# EasyEDA Pro project goddamn.epro

# Schematic Schematic1
Board Name: Board1; Create Date: 2025-03-29; Page Name: P1; Project Name: 2025329小车; Schematic Name: Schematic1; Update Date: 2025-03-29; Company: 嘉立创EDA; Page Size: A4; Version: V1.0
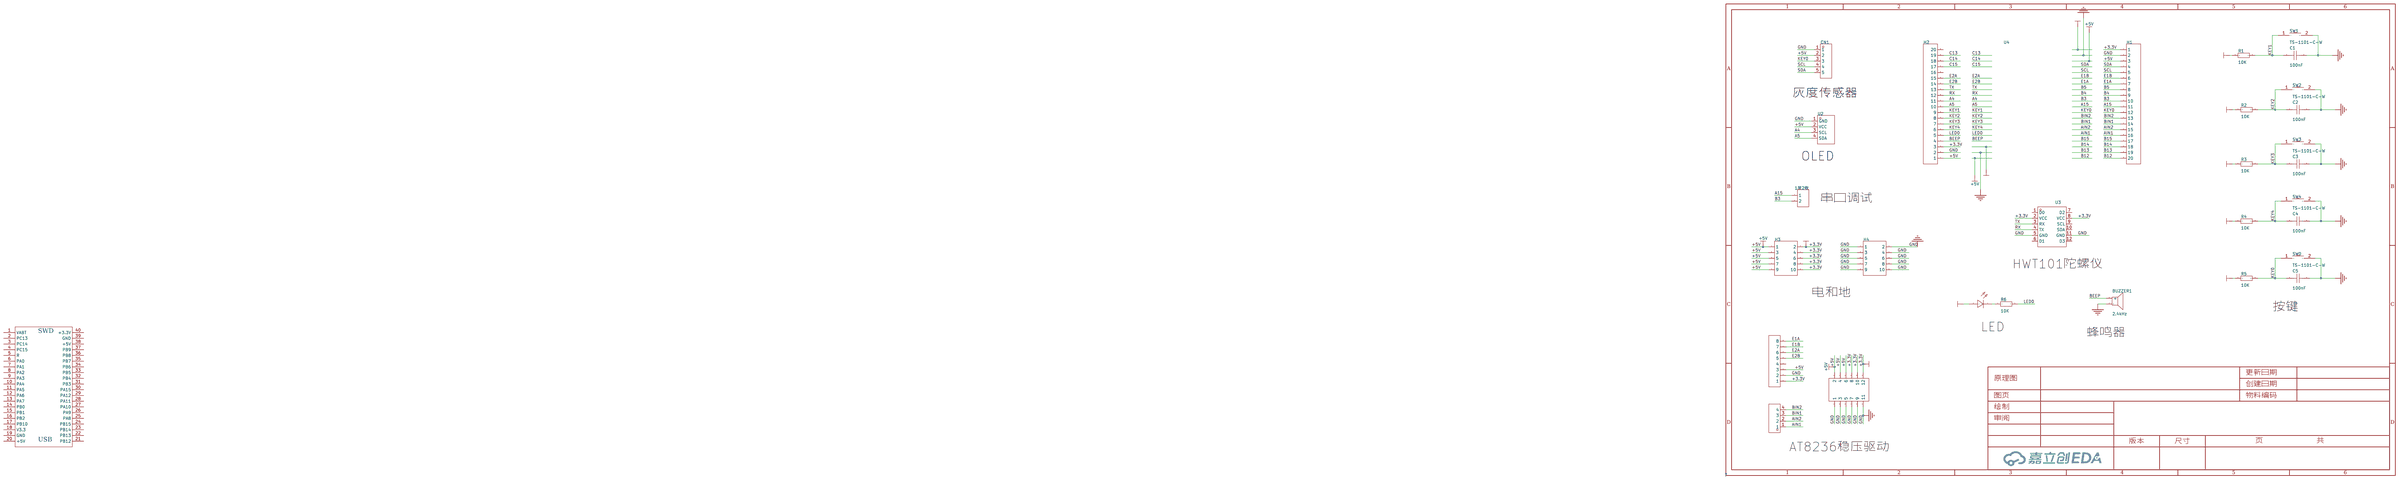
[diagram p0: schematic sheet]

## Parts
1发2收  -  [HDR-TH_2P-P2.54-V-F]
AT82361p4  -  [HDR-TH_4P-P2.54-V-F]
AT82362p6  -  [HDR-TH_12P-P2.54-V-M-R2-C6-S2.54]
BUZZER1  2.4kHz  [BUZ-TH_BD12.0-P7.60-D0.6-FD]
C1  100nF  [C0805]
C2  100nF  [C0805]
C3  100nF  [C0805]
C4  100nF  [C0805]
C5  100nF  [C0805]
CN1  灰度传感器  [CONN-TH_5P-P2.54_XH-5AW_C2908614]
H1  -  [HDR-TH_20P-P2.54-V-F]
H2  -  [HDR-TH_20P-P2.54-V-F]
H3  -  [HDR-TH_10P-P2.54-V-F-R2-C5-S2.54]
H4  -  [HDR-TH_10P-P2.54-V-F-R2-C5-S2.54]
LED1  -  [LED_0805]
R1  10K  [R0805]
R2  10K  [R0805]
R3  10K  [R0805]
R4  10K  [R0805]
R5  10K  [R0805]
R6  10K  [R0805]
SW0  TS-1101-C-W  [SW-SMD_L6.0-W3.3-LS8.0]
SW1  TS-1101-C-W  [SW-SMD_L6.0-W3.3-LS8.0]
SW2  TS-1101-C-W  [SW-SMD_L6.0-W3.3-LS8.0]
SW3  TS-1101-C-W  [SW-SMD_L6.0-W3.3-LS8.0]
SW4  TS-1101-C-W  [SW-SMD_L6.0-W3.3-LS8.0]
U1  -  [HDR-TH_8P-P2.54-V-F-1]
U2  OLED  [OLED-TH_L27.8-W27.2-P2.54_C9900033791]
U3  -  [HWT101]
U4  -  [STM32F411CEU6核心板]

## Library data of the parts
1发2收 = HDR-F_2.54_1x2P: Supplier Part: C49661; Supplier Footprint: 插件
AT82361p4 = HDR-F_2.54_1x4P: Supplier Part: C2718488; Supplier Footprint: 插件
AT82362p6 = HDR-F_2.54_2x6
BUZZER1 = TMB12A05_C96093: 驱动方式:有源(内含驱动线路);构造类型:电磁式;额定电压:-;频率:2.4kHz;声压(SPL):85dB;; LCSC Part Name: TMB12A05; Supplier Part: C96093; Manufacturer: 华能; Manufacturer Part: TMB12A05; Supplier Footprint: 插件,D=12mm; JLCPCB Part Class: 扩展库; Datasheet: https://atta.szlcsc.com/upload/public/pdf/source/20241025/8A17FE04D767D19A35A06DEF9A82AB1E.pdf; Supplier: LCSC; Driver Circuitry: 有源(内含驱动线路); Technology: 电磁式; Voltage - Supply: 4V~8V; Sound Pressure Level(SPL): 85dB; Diameter(φD): 12mm; Height: 9.8mm
C1-C5 = CAP_0805: Supplier Footprint: 0805
CN1 = XH-5AW: 插针结构:1x5P;间距:2.54mm;安装方式:弯插;参考系列:XH;总PIN数:5P;排数:1;每排PIN数:5;行距:-;额定电流:3A;触头材质:黄铜;触头镀层:锡;工作温度范围:-25℃~+85℃;; LCSC Part Name: 1x5P 间距:2.54mm 弯插 系列:XH; Supplier Part: C2908614; Manufacturer: HCTL(华灿天禄); Supplier Footprint: 弯插,P=2.5mm; JLCPCB Part Class: 扩展库; Datasheet: https://atta.szlcsc.com/upload/public/pdf/source/20230711/B565BAF3B11666EF6B81B3605408F2BD.pdf; Supplier: LCSC; Pins Structure: 1x5P; Pitch: 2.54mm; Mounting Style: 弯插; Reference Series: XH; Number of Pins: 5P; Number of Rows: 1; Number of PINs Per Row: 5; Current Rating (Max): 3A; Contact Material: 黄铜; Contact Plating: 锡; Operating Temperature Range: -25℃~+85℃
H1 H2 = HDR-F_2.54_1x20P: Supplier Part: C50984; Supplier Footprint: 插件
H3 H4 = HDR-F_2.54_2x5: Supplier Part: C92270; Supplier Footprint: 插件
LED1 = LED_0805-G: Supplier Footprint: 0805
R1-R6 = Res_0805: Supplier Footprint: 0805
SW0-SW4 = TS-1101-C-W: 电路结构:单刀单掷;按钮形状:矩形按钮;作用力:260gf;安装方式:立贴;开关长度:6mm;开关宽度:3.6mm;开关高度:2.5mm;带支架:不带;触点电流:50mA;额定电压(AC):-;额定电压(DC):12V;额定功率:-;绝缘电阻:-;带灯:无;机械寿命:5万次;; LCSC Part Name: 6*3.6*2.5mm 立贴 轻触开关; Supplier Part: C318938; Manufacturer: XKB Connectivity(中国星坤); Supplier Footprint: SMD; JLCPCB Part Class: 扩展库; Datasheet: https://atta.szlcsc.com/upload/public/pdf/source/20200227/C318938_C2E53B1EEDE37D980A33616AC086DE53.pdf; Supplier: LCSC; Circuit: 单刀单掷; Actuator Style: 矩形按钮; Operating Force: 260gf; Mounting Style: 立贴; Switch Length: 6mm; Switch Width: 3.6mm; Switch Height: 2.5mm; Strike Gundam: 不带; Contact Current: 50mA; Voltage Rating (DC): 12V; Actuator/Cap Color: 白色带淡绿; With Lamp: 无; Mechanical Life: 5万次; Operating Temperature: -30℃~+85℃
U1 = HDR-F_2.54_1x8P: Supplier Part: C27438; Supplier Footprint: 插件
U2 = HS96L03W2C03: 主控芯片:SSD1315;接口类型:I2C;尺寸(inch):0.96;像素分辨率:128x64;; LCSC Part Name: 0.96寸OLED显示屏窄白光IIC; Supplier Part: C5248080; Manufacturer: HS(汉昇); JLCPCB Part Class: 扩展库; Datasheet: https://atta.szlcsc.com/upload/public/pdf/source/20230627/763D01F79A90007632F098068C7C8AD9.pdf; Supplier: LCSC; Main Control Chip: SSD1315; Interface Type: I2C; Size: 0.96; Pixel Resolution: 128x64; Operating Temperature: -40℃~+70℃
U3 = HWT101: Pin Type: IN
U4 = STM32F411CEU6核心板

## Nets
+3.3V: AT82362p6.8 AT82362p6.10 AT82362p6.12 H1.1 H2.3 H3.2 H3.4 H3.6 H3.8 H3.10 LED1.2(A) R1.1 R2.1 R3.1 R4.1 R5.1 U1.1 U3.2(VCC) U3.8(VCC)
+5V: AT82362p6.2 AT82362p6.4 AT82362p6.6 CN1.2 H1.3 H2.1 H3.1 H3.3 H3.5 H3.7 H3.9 U1.3 U2.2(VCC)
GND: AT82362p6.1 AT82362p6.3 AT82362p6.5 AT82362p6.7 AT82362p6.9 AT82362p6.11 BUZZER1.2 C1.2 C2.2 C3.2 C4.2 C5.2 CN1.1 H1.2 H2.2 H4.1 H4.2 H4.3 H4.4 H4.5 H4.6 H4.7 H4.8 H4.9 H4.10 SW0.2 SW1.2 SW2.2 SW3.2 SW4.2 U1.2 U2.1(GND) U3.5(GND) U3.11(GND)
A4: H2.11 U2.3(SCL)
A5: H2.10 U2.4(SDA)
A15: 1发2收.1 H1.11
AIN1: AT82361p4.1 H1.16
AIN2: AT82361p4.2 H1.15
B3: 1发2收.2 H1.10
B4: H1.9
B5: H1.8
B12: H1.20
B13: H1.19
B14: H1.18
B15: H1.17
BEEP: BUZZER1.1(+) H2.4
BIN1: AT82361p4.3 H1.14
BIN2: AT82361p4.4 H1.13
C13: H2.19
C14: H2.18
C15: H2.17
E1A: H1.7 U1.8
E1B: H1.6 U1.7
E2A: H2.15 U1.6
E2B: H2.14 U1.5
KEY0: C5.1 CN1.3 H1.12 R5.2 SW0.1
KEY1: C1.1 H2.9 R1.2 SW1.1
KEY2: C2.1 H2.8 R2.2 SW2.1
KEY3: C3.1 H2.7 R3.2 SW3.1
KEY4: C4.1 H2.6 R4.2 SW4.1
LED0: H2.5 R6.2
RX: H2.12 U3.4(TX)
SCL: CN1.4 H1.5
SDA: CN1.5 H1.4
TX: H2.13 U3.3(RX)
Net-(LED1-1): LED1.1(C) R6.1

Not connected (* = marked no-connect by the designer): H2 16 20; U1 4; U3 1(D0) 6(D1) 7(D2) 9(SCL) 10(SDA) 12(D3); U4 1(VABT) 2(PC13) 3(PC14) 4(PC15) 5(R) 6(PA0) 7(PA1) 8(PA2) 9(PA3) 10(PA4) 11(PA5) 12(PA6) 13(PA7) 14(PB0) 15(PB1) 16(PB2) 17(PB10) 18(V3.3) 19(GND) 20(+5V) 21(PB12) 22(PB13) 23(PB14) 24(PB15) 25(PA8) 26(PA9) 27(PA10) 28(PA11) 29(PA12) 30(PA15) 31(PB3) 32(PB4) 33(PB5) 34(PB6) 35(PB7) 36(PB8) 37(PB9) 38(+5V) 39(GND) 40(+3.3V)

## Notes on the sheet
- 串口调试
- HWT101陀螺仪
- 电和地
- 按键
- LED
- 蜂鸣器
- AT8236稳压驱动

# Board PCB1
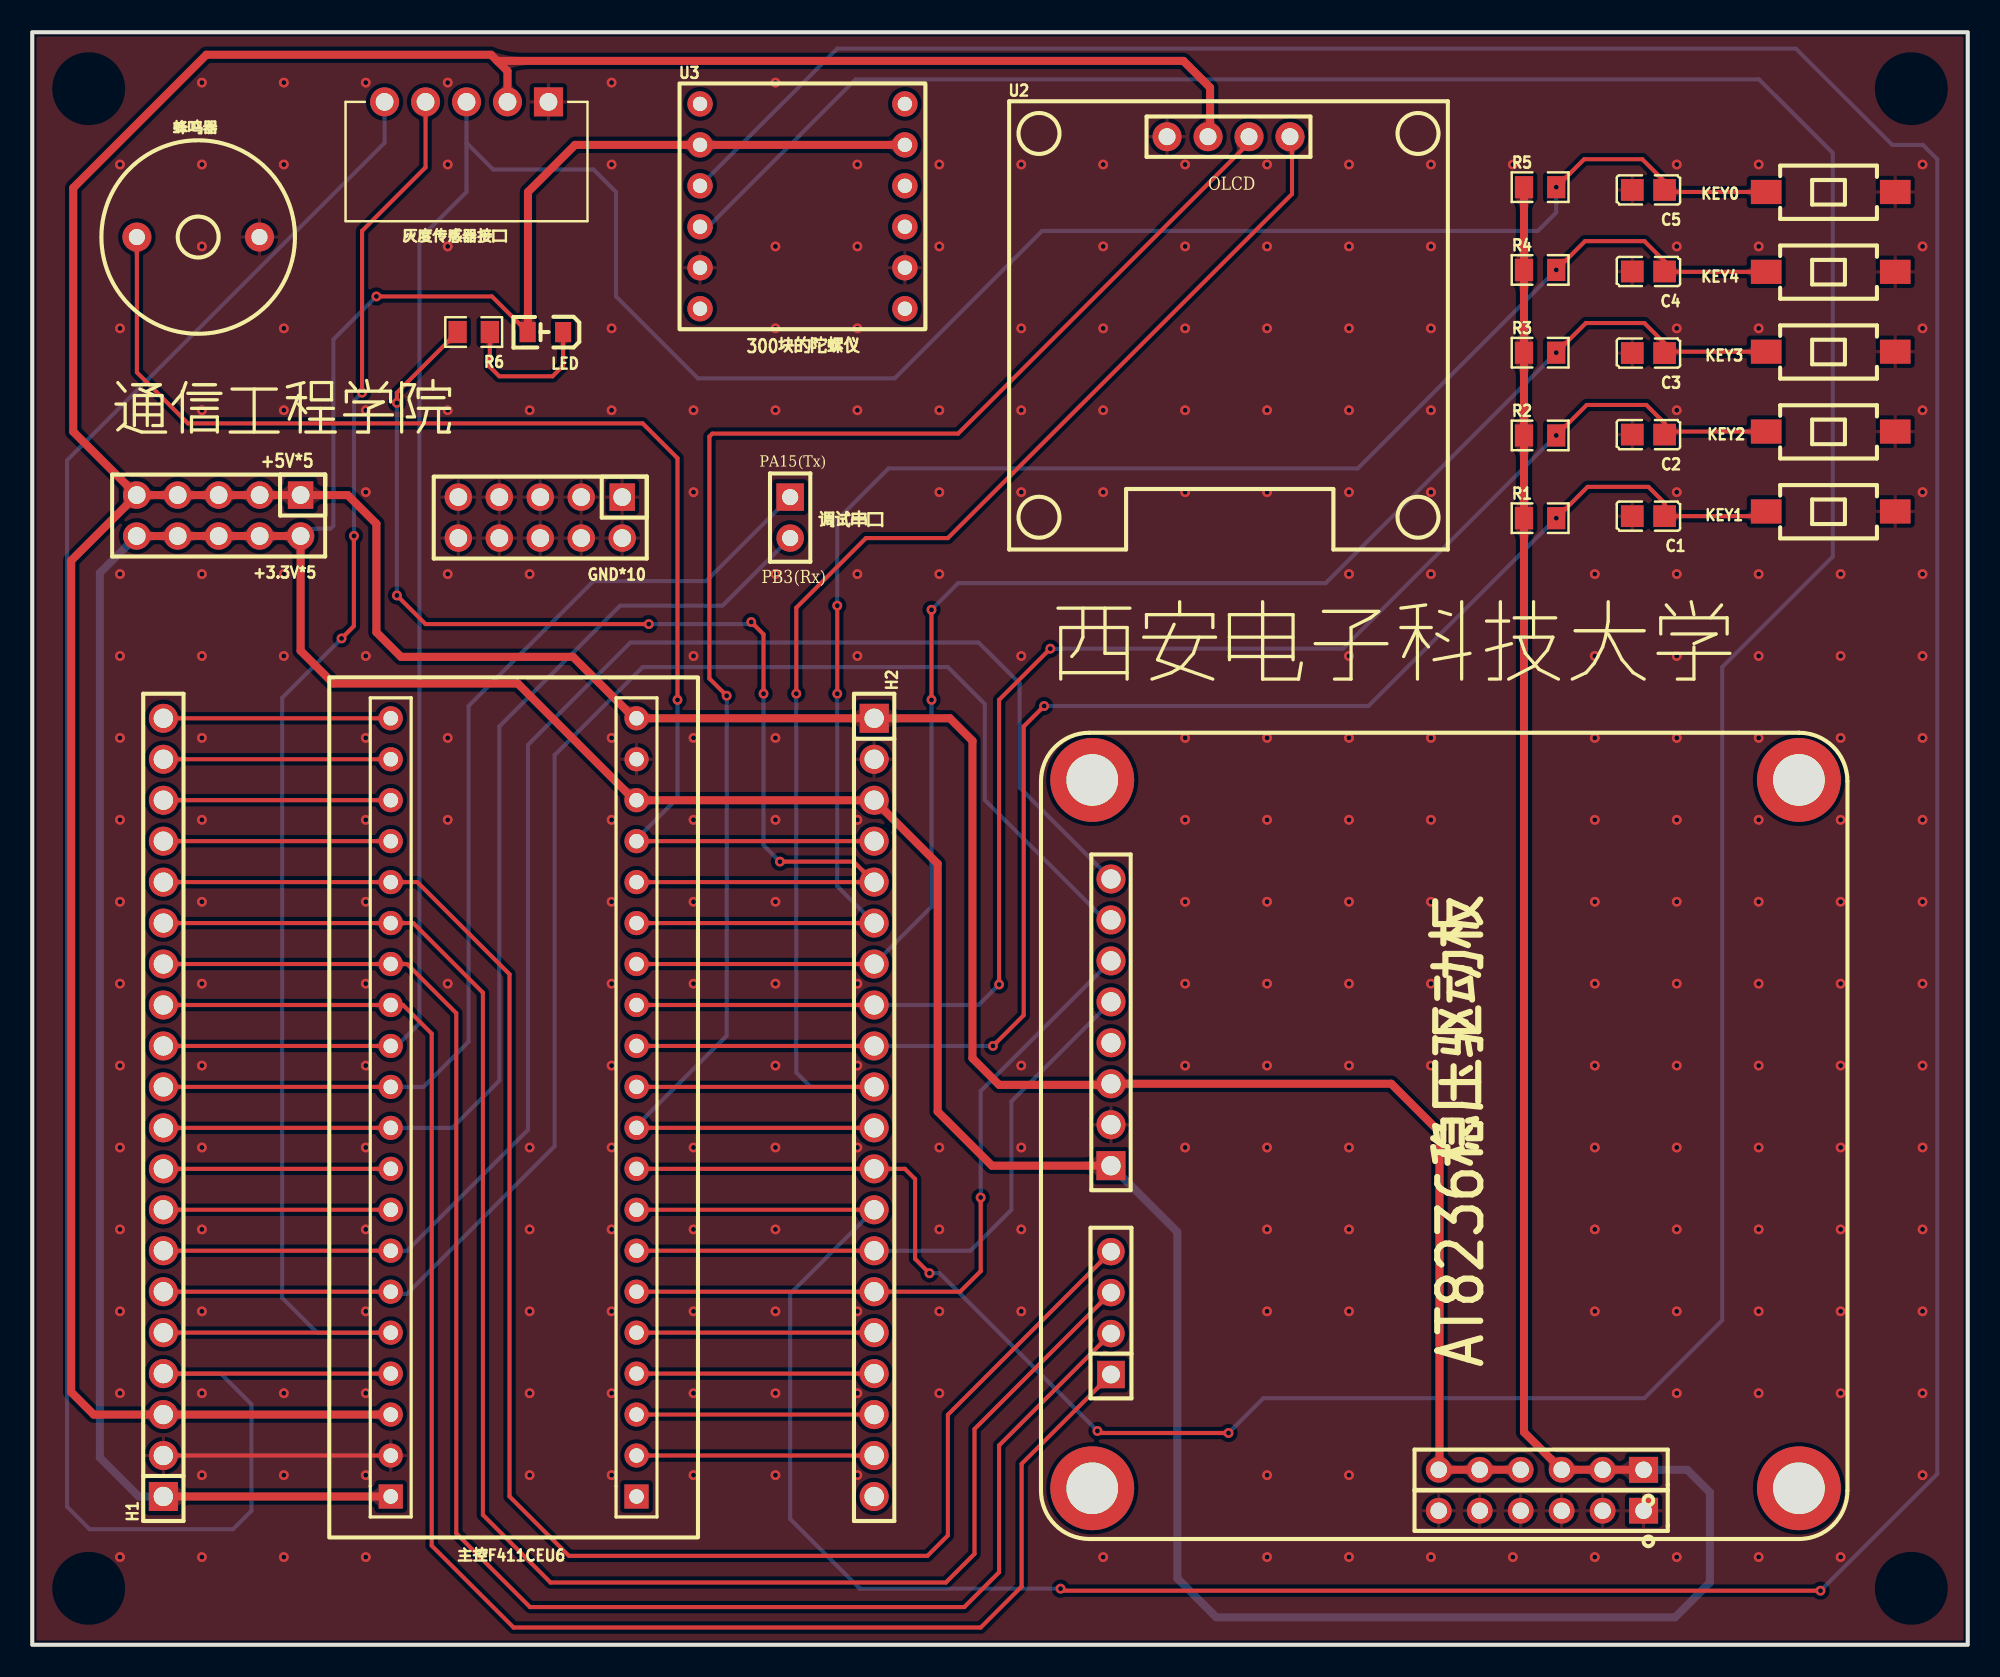
[diagram p1: board, top side]
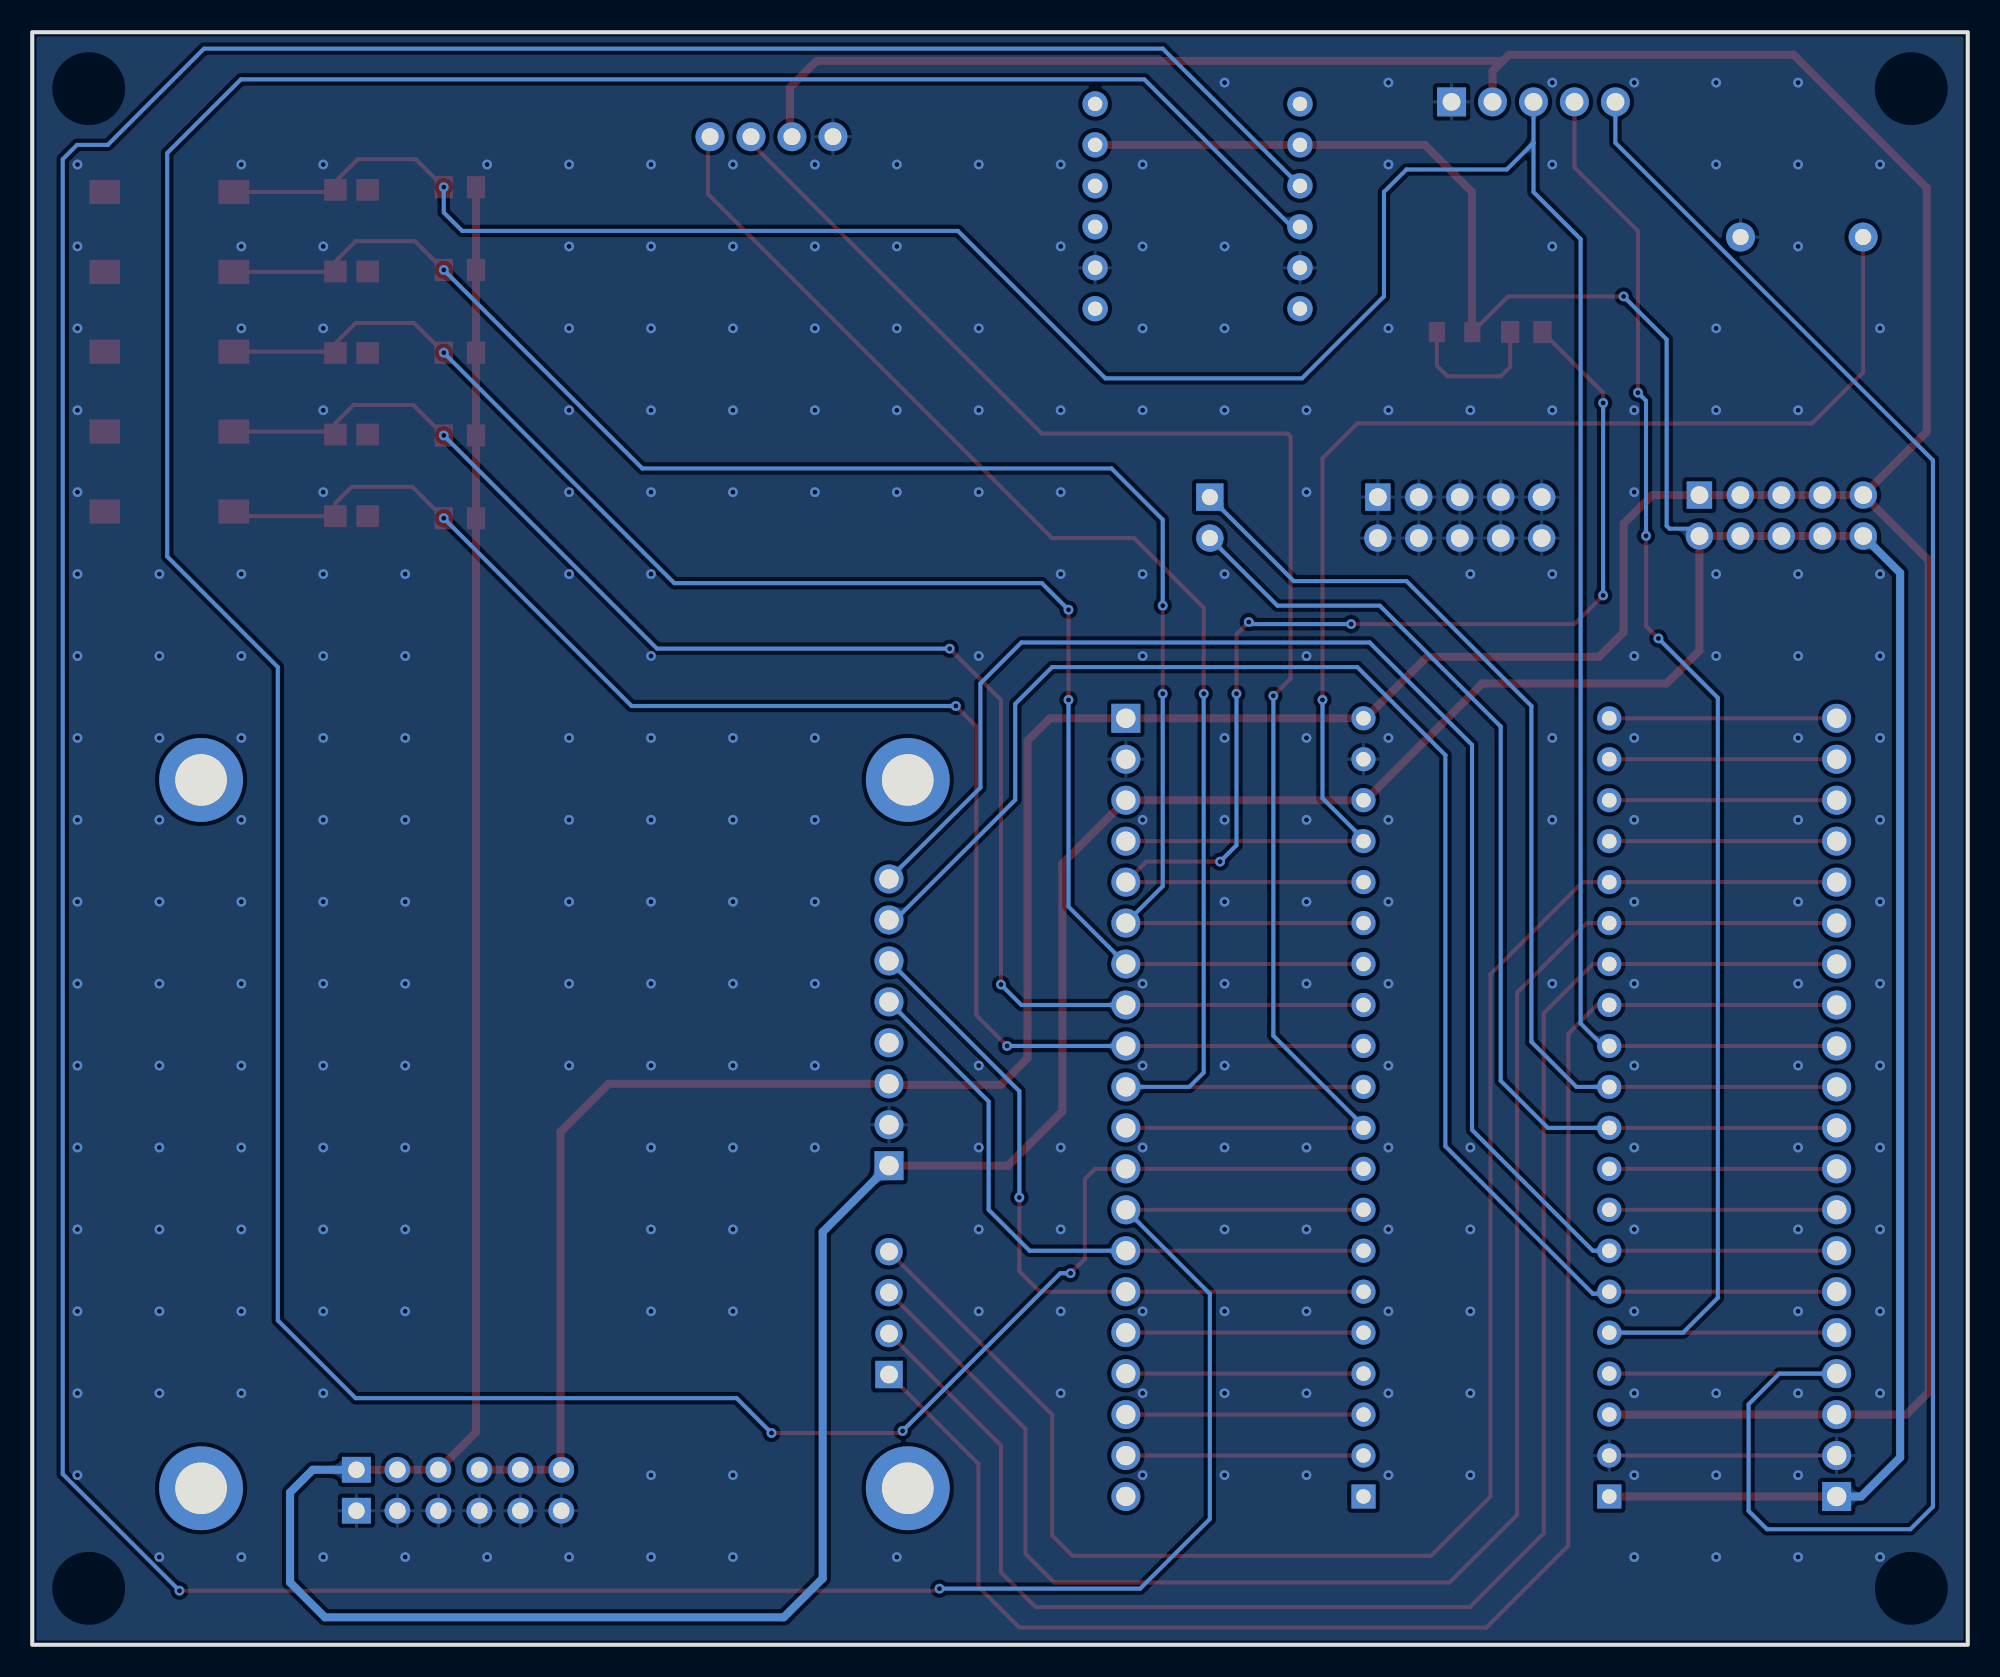
[diagram p2: board, bottom side, seen from below]

Outline 120 x 100 mm; copper layers: Top Layer, Bottom Layer. Coordinates in mm from the lower left corner of the outline.
Outline path: rectangle 0,100 120,0
Stack: Top Layer 0.035mm / Dielectric1 1.51mm FR4 er 4.5 / Bottom Layer 0.035mm

## Design rules (mm)
template: JLCPCB Capability(Two Layers Board)
spacing copperThickness1oz (default): track to track 0.102, other pairs 0.152 to 0.3
spacing copperThickness2oz: track to track 0.203, other pairs 0.152 to 0.3
track width copperThickness1oz (default): min 0.127, default 0.254, max 2.54
track width copperThickness2oz: min 0.203, default 0.254, max 2.54
differential pair differentialPair (default): width min 0.127, default 0.254, max 2.54; gap min 0.152, default 0.152
via viaSize (default): diameter min 0.5, default 0.61, max 10; hole min 0.3, default 0.305, max 6.3

## Placement (name value [footprint] x y rotation side)
+3.3V*5  -  [HDR-TH_10P-P2.54-V-F-R2-C5-S2.54]  11.56 70.03 180 top
C1  100nF  [C0805]  100.2 69.99 180 top
C2  100nF  [C0805]  100.2 75.05 180 top
C3  100nF  [C0805]  100.2 80.11 180 top
C4  100nF  [C0805]  100.2 85.16 180 top
C5  100nF  [C0805]  100.2 90.22 180 top
GND*10  -  [HDR-TH_10P-P2.54-V-F-R2-C5-S2.54]  31.5 69.9 180 top
H1  -  [HDR-TH_20P-P2.54-V-F]  8.13 33.33 90 top
H2  -  [HDR-TH_20P-P2.54-V-F]  52.2 33.33 270 top
H20  -  [HDR-TH_8P-P2.54-V-F-1]  66.88 38.6 90 top
H21  -  [HDR-TH_4P-P2.54-V-F]  66.88 20.57 90 top
H22  -  [HDR-TH_6P-P2.54-V-F]  93.55 8.31 180 top
H23  -  [HDR-TH_6P-P2.54-V-F]  93.55 10.85 180 top
KEY0  TS-1101-C-W  [SW-SMD_L6.0-W3.3-LS8.0]  111.51 90.09 0 top
KEY1  TS-1101-C-W  [SW-SMD_L6.0-W3.3-LS8.0]  111.51 70.28 0 top
KEY2  TS-1101-C-W  [SW-SMD_L6.0-W3.3-LS8.0]  111.51 75.23 0 top
KEY3  TS-1101-C-W  [SW-SMD_L6.0-W3.3-LS8.0]  111.51 80.19 0 top
KEY4  TS-1101-C-W  [SW-SMD_L6.0-W3.3-LS8.0]  111.51 85.14 0 top
LED  -  [LED_0805]  31.76 81.41 180 top
PA15(Tx)  -  [HDR-TH_2P-P2.54-V-F]  46.99 69.9 270 top
R1  10K  [R0805]  93.49 69.86 0 top
R2  10K  [R0805]  93.49 75 0 top
R3  10K  [R0805]  93.49 80.13 0 top
R4  10K  [R0805]  93.49 85.26 0 top
R5  10K  [R0805]  93.49 90.39 0 top
R6  10K  [R0805]  27.37 81.41 180 top
SCREW3  -  [M3螺丝]  109.53 53.63 90 top
SCREW5  -  [M3螺丝]  109.53 9.7 90 top
SCREW6  -  [M3螺丝]  65.72 53.63 90 top
SCREW7  -  [M3螺丝]  65.72 9.7 90 top
U2  OLED  [OLED-TH_L27.8-W27.2-P2.54_C9900033791]  74.17 93.52 0 top
U3  -  [HWT101]  47.75 89.2 0 top
主控F411CEU6  -  [STM32F411CEU6核心板]  18.29 6.53 90 top
灰度传感器接口  灰度传感器  [CONN-TH_5P-P2.54_XH-5AW_C2908614]  26.92 95.68 180 top
蜂鸣器  2.4kHz  [BUZ-TH_BD12.0-P7.60-D0.6-FD]  10.29 87.3 0 top

## Footprints (pads in the part's own frame, mm; a bottom-side part is the same pattern mirrored in y, then rotated)
BUZ-TH_BD12.0-P7.60-D0.6-FD
  round 1.8 hole 1: 1(-3.8,0) 2(3.8,0)
C0805
  rect 1.41x1.35 smd: 1(-1,0) 2(1,0)
CONN-TH_5P-P2.54_XH-5AW_C2908614
  rect 1.8x1.8 hole 1.1: 1(-5.08,0)
  round 1.8 hole 1.1: 2(-2.54,0) 3(0,0) 4(2.54,0) 5(5.08,0)
HDR-TH_2P-P2.54-V-F
  rect 1.7x1.7 hole 1: 1(-1.27,0)
  round 1.7 hole 1: 2(1.27,0)
HDR-TH_4P-P2.54-V-F
  rect 1.7x1.7 hole 1.1: 1(-3.81,0)
  round 1.7 hole 1.1: 2(-1.27,0) 3(1.27,0) 4(3.81,0)
HDR-TH_6P-P2.54-V-F
  rect 1.8x1.6 hole 1.02: 1(-6.35,0)
  round 1.6 hole 1.02: 2(-3.81,0) 3(-1.27,0) 4(1.27,0) 5(3.81,0) 6(6.35,0)
HDR-TH_8P-P2.54-V-F-1
  rect 1.8x1.8 hole 1.2: 1(-8.89,0)
  round 1.8 hole 1.2: 2(-6.35,0) 3(-3.81,0) 4(-1.27,0) 5(1.27,0) 6(3.81,0) 7(6.35,0) 8(8.89,0)
HDR-TH_10P-P2.54-V-F-R2-C5-S2.54
  rect 1.575x1.7 hole 1.1: 1(-5.08,-1.27)
  round 1.7 hole 1.1: 2(-5.08,1.27) 3(-2.54,-1.27) 4(-2.54,1.27) 5(0,-1.27) 6(0,1.27) 7(2.54,-1.27) 8(2.54,1.27) 9(5.08,-1.27) 10(5.08,1.27)
HDR-TH_20P-P2.54-V-F
  rect 1.8x1.8 hole 1.2: 1(-24.13,0)
  round 1.8 hole 1.2: 2(-21.59,0) 3(-19.05,0) 4(-16.51,0) 5(-13.97,0) 6(-11.43,0) 7(-8.89,0) 8(-6.35,0) 9(-3.81,0) 10(-1.27,0) 11(1.27,0) 12(3.81,0) 13(6.35,0) 14(8.89,0) 15(11.43,0) 16(13.97,0) 17(16.51,0) 18(19.05,0) 19(21.59,0) 20(24.13,0)
HWT101
  round 1.575 hole 0.889: 1(-6.35,6.35) 2(-6.35,3.81) 3(-6.35,1.27) 4(-6.35,-1.27) 5(-6.35,-3.81) 6(-6.35,-6.35) 7(6.35,6.35) 8(6.35,3.81) 9(6.35,1.27) 10(6.35,-1.27) 11(6.35,-3.81) 12(6.35,-6.35)
LED_0805
  rect 1x1.25 smd: 1(-1.15,0.005) 2(1.05,0.005)
M3螺丝
  round 5.2 hole 3.2: 1(0,0)
OLED-TH_L27.8-W27.2-P2.54_C9900033791
  round 1.8 hole 1.05: 1(-3.81,0) 2(-1.27,0) 3(1.27,0) 4(3.81,0)
R0805
  rect 1.133x1.377 smd: 1(-1,0) 2(1,0)
STM32F411CEU6核心板
  rect 1.5x1.5 hole 0.9: 1(2.667,-19.177)
  round 1.5 hole 0.9: 2(5.207,-19.177) 3(7.747,-19.177) 4(10.287,-19.177) 5(12.827,-19.177) 6(15.367,-19.177) 7(17.907,-19.177) 8(20.447,-19.177) 9(22.987,-19.177) 10(25.527,-19.177) 11(28.067,-19.177) 12(30.607,-19.177) 13(33.147,-19.177) 14(35.687,-19.177) 15(38.227,-19.177) 16(40.767,-19.177) 17(43.307,-19.177) 18(45.847,-19.177) 19(48.387,-19.177) 20(50.927,-19.177)
  round 1.5 hole 0.905x0.9: 21(50.927,-3.937) 22(48.387,-3.937) 23(45.847,-3.937) 24(43.307,-3.937) 25(40.767,-3.937) 26(38.227,-3.937) 27(35.687,-3.937) 28(33.147,-3.937) 29(30.607,-3.937) 30(28.067,-3.937) 31(25.527,-3.937) 32(22.987,-3.937) 33(20.447,-3.937) 34(17.907,-3.937) 35(15.367,-3.937) 36(12.827,-3.937) 37(10.287,-3.937) 38(7.747,-3.937) 39(5.207,-3.937)
  rect 1.5x1.5 hole 0.905x0.9: 40(2.667,-3.937)
SW-SMD_L6.0-W3.3-LS8.0
  rect 1.9x1.5 smd: 1(-4,0) 2(4,0)

## Nets
+3.3V: +3.3V*5.2 +3.3V*5.4 +3.3V*5.6 +3.3V*5.8 +3.3V*5.10 H1.1 H2.3 H20.1 H23.1 H23.2 H23.3 LED.2 R1.1 R2.1 R3.1 R4.1 R5.1 U3.2 U3.8 主控F411CEU6.18 主控F411CEU6.40
+5V: +3.3V*5.1 +3.3V*5.3 +3.3V*5.5 +3.3V*5.7 +3.3V*5.9 H1.3 H2.1 H20.3 H23.4 H23.5 H23.6 U2.2 主控F411CEU6.20 主控F411CEU6.38 灰度传感器接口.2
GND: C1.2 C2.2 C3.2 C4.2 C5.2 GND*10.1 GND*10.2 GND*10.3 GND*10.4 GND*10.5 GND*10.6 GND*10.7 GND*10.8 GND*10.9 GND*10.10 H1.2 H2.2 H20.2 H22.1 H22.2 H22.3 H22.4 H22.5 H22.6 KEY0.2 KEY1.2 KEY2.2 KEY3.2 KEY4.2 U2.1 U3.5 U3.11 主控F411CEU6.19 主控F411CEU6.39 灰度传感器接口.1 蜂鸣器.2
A4: H2.11 U2.3 主控F411CEU6.10
A5: H2.10 U2.4 主控F411CEU6.11
A15: H1.11 PA15(Tx).1 主控F411CEU6.30
AIN1: H1.16 H21.4 主控F411CEU6.25
AIN2: H1.15 H21.3 主控F411CEU6.26
B3: H1.10 PA15(Tx).2 主控F411CEU6.31
B4: H1.9 主控F411CEU6.32
B5: H1.8 主控F411CEU6.33
B12: H1.20 主控F411CEU6.21
B13: H1.19 主控F411CEU6.22
B14: H1.18 主控F411CEU6.23
B15: H1.17 主控F411CEU6.24
BEEP: H2.4 主控F411CEU6.17 蜂鸣器.1
BIN1: H1.14 H21.2 主控F411CEU6.27
BIN2: H1.13 H21.1 主控F411CEU6.28
C13: H2.19 主控F411CEU6.2
C14: H2.18 主控F411CEU6.3
C15: H2.17 主控F411CEU6.4
E1A: H1.7 H20.8 主控F411CEU6.34
E1B: H1.6 H20.7 主控F411CEU6.35
E2A: H2.15 H20.6 主控F411CEU6.6
E2B: H2.14 H20.5 主控F411CEU6.7
KEY0: C5.1 H1.12 KEY0.1 R5.2 主控F411CEU6.29 灰度传感器接口.3
KEY1: C1.1 H2.9 KEY1.1 R1.2 主控F411CEU6.12
KEY2: C2.1 H2.8 KEY2.1 R2.2 主控F411CEU6.13
KEY3: C3.1 H2.7 KEY3.1 R3.2 主控F411CEU6.14
KEY4: C4.1 H2.6 KEY4.1 R4.2 主控F411CEU6.15
LED0: H2.5 R6.2 主控F411CEU6.16
RX: H2.12 U3.4 主控F411CEU6.9
SCL: H1.5 主控F411CEU6.36 灰度传感器接口.4
SDA: H1.4 主控F411CEU6.37 灰度传感器接口.5
TX: H2.13 U3.3 主控F411CEU6.8
$1N3173: LED.1 R6.1

Pads without a net: H2 16 20; H20 4; SCREW3 1; SCREW5 1; SCREW6 1; SCREW7 1; U3 1 6 7 9 10 12; 主控F411CEU6 1 5

## Via types
v1: diameter 0.61, hole 0.305, Top Layer to Bottom Layer, 309 vias

## Routing (per net, layer and track width the routed paths; a pad name or vN(x,y) marks a point on that pad's centre or on a via; arc(x,y) is an arc through that point)
+3.3V: length 386
  Top Layer w0.254: v1(21.34,83.62) 28.5,83.62 LED.2
  Top Layer w0.5: U3.8 U3.2 33.66,93.02 30.73,90.09 30.73,81.42 LED.2 ; H23.1 H23.2 H23.3 92.49,13.19 R1.1 R2.1 R3.1 R4.1 R5.1 ; H1.1 22.1,9.19 ; H20.1 59.5,29.71 56.13,33.07 56.13,48.44 H2.3 37.34,52.38 30.1,59.61 18.67,59.61 16.64,61.65 +3.3V*5.2 +3.3V*5.6 +3.3V*5.8 +3.3V*5.10
  Bottom Layer w0.254: +3.3V*5.2 17.09,69.21 18.49,69.21 18.67,69.39 18.67,80.95 v1(21.34,83.62)
  Bottom Layer w0.5: H1.1 6.6,9.19 4.19,11.61 4.19,66.47 +3.3V*5.10 ; H20.1 70.99,25.6 70.99,4.12 73.41,1.7 101.85,1.7 104.01,3.86 104.01,9.45 102.61,10.85 H23.1
+5V: length 317.8
  Top Layer w0.5: +3.3V*5.9 2.41,67.23 2.41,15.67 3.81,14.28 H1.3 22.1,14.28 ; +3.3V*5.9 2.54,75.23 2.54,90.35 10.8,98.6 28.45,98.6 28.83,98.22 ; +3.3V*5.9 +3.3V*5.7 +3.3V*5.5 +3.3V*5.1 19.56,71.3 21.34,69.52 21.34,62.79 22.86,61.27 33.53,61.27 37.34,57.45 H2.1 56.9,57.45 58.29,56.06 58.29,36.37 59.94,34.72 66.81,34.72 H20.3 84.26,34.79 87.25,31.8 87.25,10.9 H23.6 H23.5 H23.4 ; 73.03,93.27 73.03,96.57 71.37,98.22 28.83,98.22 ; 28.83,98.22 29.46,97.59 灰度传感器接口.2
GND: length 14
  Top Layer w0.254: H1.2 22.1,11.74
  vias: v1(5.44,91.8) v1(5.44,81.64) v1(5.44,66.4) v1(5.44,61.32) v1(5.44,56.24) v1(5.44,51.16) v1(5.44,46.08) v1(5.44,41) v1(5.44,35.92) v1(5.44,30.84) v1(5.44,25.76) v1(5.44,20.68) v1(5.44,15.6) v1(5.44,5.44) v1(10.52,96.88) v1(10.52,91.8) v1(10.52,86.72) v1(10.52,76.56) v1(10.52,66.4) v1(10.52,61.32) v1(10.52,56.24) v1(10.52,51.16) v1(10.52,46.08) v1(10.52,41) v1(10.52,35.92) v1(10.52,30.84) v1(10.52,25.76) v1(10.52,20.68) v1(10.52,15.6) v1(10.52,10.52) v1(10.52,5.44) v1(15.6,96.88) v1(15.6,91.8) v1(15.6,81.64) v1(15.6,76.56) v1(15.6,66.4) v1(15.6,61.32) v1(15.6,15.6) v1(15.6,10.52) v1(15.6,5.44) v1(20.68,96.88) v1(20.68,76.56) v1(20.68,71.48) v1(20.68,61.32) v1(20.68,56.24) v1(20.68,51.16) v1(20.68,46.08) v1(20.68,41) v1(20.68,35.92) v1(20.68,30.84) v1(20.68,25.76) v1(20.68,20.68) v1(20.68,15.6) v1(20.68,10.52) v1(20.68,5.44) v1(25.76,96.88) v1(25.76,91.8) v1(25.76,86.72) v1(25.76,76.56) v1(25.76,66.4) v1(25.76,56.24) v1(25.76,51.16) v1(25.76,41) v1(30.84,76.56) v1(30.84,66.4) v1(30.84,30.84) v1(30.84,25.76) v1(30.84,20.68) v1(30.84,15.6) v1(30.84,10.52) v1(35.92,96.88) v1(35.92,91.8) v1(35.92,81.64) v1(35.92,76.56) v1(35.92,56.24) v1(35.92,51.16) v1(35.92,46.08) v1(35.92,41) v1(35.92,35.92) v1(35.92,30.84) v1(35.92,25.76) v1(35.92,20.68) v1(35.92,15.6) v1(35.92,10.52) v1(41,76.56) v1(41,71.48) v1(41,61.32) v1(41,56.24) v1(41,51.16) v1(41,46.08) v1(41,41) v1(41,30.84) v1(41,25.76) v1(41,20.68) v1(41,15.6) v1(41,10.52) v1(46.08,96.88) v1(46.08,86.72) v1(46.08,81.64) v1(46.08,76.56) v1(46.08,66.4) v1(46.08,56.24) v1(46.08,51.16) v1(46.08,46.08) v1(46.08,41) v1(46.08,35.92) v1(46.08,30.84) v1(46.08,25.76) v1(46.08,20.68) v1(46.08,15.6) v1(46.08,10.52) v1(51.16,91.8) v1(51.16,86.72) v1(51.16,81.64) v1(51.16,76.56) v1(51.16,66.4) v1(51.16,61.32) v1(51.16,51.16) v1(51.16,41) v1(51.16,35.92) v1(51.16,30.84) v1(51.16,20.68) v1(51.16,15.6) v1(51.16,10.52) v1(56.24,91.8) v1(56.24,86.72) v1(56.24,76.56) v1(56.24,71.48) v1(56.24,66.4) v1(56.24,30.84) v1(56.24,25.76) v1(56.24,20.68) v1(56.24,15.6) v1(61.32,91.8) v1(61.32,81.64) v1(61.32,76.56) v1(61.32,71.48) v1(61.32,61.32) v1(61.32,35.92) v1(61.32,30.84) v1(61.32,25.76) v1(61.32,20.68) v1(66.4,91.8) v1(66.4,86.72) v1(66.4,81.64) v1(66.4,76.56) v1(66.4,71.48) v1(66.4,5.44) v1(71.48,91.8) v1(71.48,86.72) v1(71.48,81.64) v1(71.48,76.56) v1(71.48,71.48) v1(71.48,56.24) v1(71.48,51.16) v1(71.48,46.08) v1(71.48,41) v1(71.48,35.92) v1(71.48,30.84) v1(76.56,91.8) v1(76.56,86.72) v1(76.56,81.64) v1(76.56,76.56) v1(76.56,71.48) v1(76.56,56.24) v1(76.56,51.16) v1(76.56,46.08) v1(76.56,41) v1(76.56,35.92) v1(76.56,30.84) v1(76.56,25.76) v1(76.56,20.68) v1(76.56,10.52) v1(76.56,5.44) v1(81.64,91.8) v1(81.64,86.72) v1(81.64,81.64) v1(81.64,76.56) v1(81.64,71.48) v1(81.64,66.4) v1(81.64,61.32) v1(81.64,56.24) v1(81.64,51.16) v1(81.64,46.08) v1(81.64,41) v1(81.64,35.92) v1(81.64,30.84) v1(81.64,25.76) v1(81.64,20.68) v1(81.64,10.52) v1(81.64,5.44) v1(86.72,91.8) v1(86.72,86.72) v1(86.72,81.64) v1(86.72,76.56) v1(86.72,71.48) v1(86.72,66.4) v1(86.72,56.24) v1(86.72,51.16) v1(86.72,46.08) v1(86.72,41) v1(86.72,35.92) v1(86.72,5.44) v1(91.8,91.8) v1(91.8,5.44) v1(96.88,66.4) v1(96.88,61.32) v1(96.88,56.24) v1(96.88,51.16) v1(96.88,46.08) v1(96.88,41) v1(96.88,35.92) v1(96.88,30.84) v1(96.88,25.76) v1(96.88,20.68) v1(96.88,5.44) v1(101.96,91.8) v1(101.96,86.72) v1(101.96,81.64) v1(101.96,76.56) v1(101.96,71.48) v1(101.96,66.4) v1(101.96,61.32) v1(101.96,56.24) v1(101.96,51.16) v1(101.96,46.08) v1(101.96,41) v1(101.96,35.92) v1(101.96,30.84) v1(101.96,25.76) v1(101.96,20.68) v1(101.96,15.6) v1(101.96,5.44) v1(107.04,91.8) v1(107.04,86.72) v1(107.04,81.64) v1(107.04,66.4) v1(107.04,61.32) v1(107.04,56.24) v1(107.04,51.16) v1(107.04,46.08) v1(107.04,41) v1(107.04,35.92) v1(107.04,30.84) v1(107.04,25.76) v1(107.04,20.68) v1(107.04,15.6) v1(107.04,5.44) v1(112.12,66.4) v1(112.12,61.32) v1(112.12,56.24) v1(112.12,51.16) v1(112.12,46.08) v1(112.12,41) v1(112.12,35.92) v1(112.12,30.84) v1(112.12,25.76) v1(112.12,20.68) v1(112.12,15.6) v1(112.12,5.44) v1(117.2,91.8) v1(117.2,86.72) v1(117.2,81.64) v1(117.2,76.56) v1(117.2,71.48) v1(117.2,66.4) v1(117.2,61.32) v1(117.2,56.24) v1(117.2,51.16) v1(117.2,46.08) v1(117.2,41) v1(117.2,35.92) v1(117.2,30.84) v1(117.2,25.76) v1(117.2,20.68) v1(117.2,15.6) v1(117.2,10.52)
(no net): length 14.9
  Top Layer w0.254: H2.16 37.34,19.35
A4: length 101.7
  Top Layer w0.254: v1(43.05,58.85) 41.98,59.92 41.98,74.93 42.16,75.11 57.4,75.11 75.56,93.27 ; 37.34,32.06 H2.11
  Bottom Layer w0.254: 37.34,32.06 43.05,37.77 v1(43.05,58.85)
A5: length 93.5
  Top Layer w0.254: H2.10 37.34,34.59 ; v1(47.37,58.98) 47.37,64.31 51.69,68.63 56.77,68.63 78.1,89.97 78.1,93.27
  Bottom Layer w0.254: v1(47.37,58.98) 47.37,35.48 48.26,34.59 H2.10
A15: length 66.1
  Top Layer w0.254: H1.11 22.1,34.59
  Bottom Layer w0.254: 46.99,71.17 41.78,65.96 34.8,65.96 27.05,58.22 27.05,37.39 24.26,34.59 主控F411CEU6.30
AIN1: length 107.2
  Top Layer w0.254: H21.4 56.77,14.27 56.77,6.78 55.5,5.51 33.27,5.51 29.59,9.19 29.59,41.58 23.88,47.3 H1.16
AIN2: length 106.6
  Top Layer w0.254: H21.3 58.42,13.38 58.42,5.64 56.64,3.86 32.13,3.86 27.94,8.05 27.94,40.44 23.62,44.75 H1.15
B3: length 66.8
  Top Layer w0.254: 22.1,32.06 H1.10
  Bottom Layer w0.254: PA15(Tx).2 42.8,64.44 36.45,64.44 28.96,56.95 28.96,34.98 26.03,32.06 22.22,32.06
B4: length 14
  Top Layer w0.254: 8.13,29.51 22.1,29.51
B5: length 14
  Top Layer w0.254: 22.1,26.97 H1.8
B12: length 14
  Top Layer w0.254: 22.1,57.45 H1.20
B13: length 14
  Top Layer w0.254: H1.19 22.1,54.92
B14: length 14
  Top Layer w0.254: H1.18 22.1,52.38
B15: length 14
  Top Layer w0.254: H1.17 22.1,49.83
BEEP: length 83.8
  Top Layer w0.254: v1(40,58.6) 40,73.58 37.85,75.74 9.65,75.74 6.49,78.91 蜂鸣器.1 ; 37.34,49.83 H2.4
  Bottom Layer w0.254: v1(40,58.6) 40,52.5 37.34,49.83
BIN1: length 105.8
  Top Layer w0.254: H1.14 23.24,42.22 26.29,39.17 26.29,6.91 30.86,2.34 57.78,2.34 59.94,4.5 59.94,12.36 66.88,19.3
BIN2: length 104.3
  Top Layer w0.254: H1.13 22.99,39.67 24.77,37.9 24.77,6.15 29.84,1.07 58.8,1.07 61.34,3.61 61.34,11.22 H21.1
C13: length 14.9
  Top Layer w0.254: 37.34,11.74 H2.19
C14: length 14.9
  Top Layer w0.254: H2.18 37.34,14.28
C15: length 14.9
  Top Layer w0.254: 37.34,16.81 H2.17
E1A: length 98.2
  Top Layer w0.254: H1.7 22.1,24.44
  Bottom Layer w0.254: H20.8 61.21,53.16 61.21,59.61 58.67,62.15 37.08,62.15 30.73,55.8 30.73,31.93 23.24,24.44 22.1,24.44
E1B: length 99.1
  Top Layer w0.254: 22.1,21.9 H1.6
  Bottom Layer w0.254: 22.1,21.9 22.22,21.77 23.24,21.77 32.39,30.91 32.39,55.17 37.85,60.63 56.77,60.63 59.06,58.34 59.06,52.4 66.5,44.95 H20.7
E2A: length 44.6
  Top Layer w0.254: 37.34,21.9 H2.15 57.53,21.9 58.8,23.16 v1(58.8,27.74)
  Bottom Layer w0.254: v1(58.8,27.74) 58.8,34.33 H20.6
E2B: length 39.9
  Top Layer w0.254: H2.14 37.34,24.44
  Bottom Layer w0.254: H2.14 58.17,24.44 60.71,26.97 60.71,33.69 H20.5
KEY0: length 173.1
  Top Layer w0.254: 101.33,90.09 101.33,90.62 99.82,92.13 96.22,92.13 v1(94.49,90.39) ; 101.33,90.09 C5.1 ; 101.33,90.09 KEY0.1 ; H1.12 22.1,37.14
  Bottom Layer w0.254: v1(94.49,90.39) 94.49,88.82 93.34,87.68 62.61,87.68 53.47,78.54 41.28,78.54 36.19,83.62 36.19,90.09 34.8,91.49 28.58,91.49 26.92,93.14 ; 26.92,93.14 26.92,90.09 24,87.17 24,38.53 22.61,37.14 22.1,37.14 ; 26.92,93.14 灰度传感器接口.3
KEY1: length 96.4
  Top Layer w0.254: v1(59.56,37.14) 61.47,39.04 61.47,56.95 v1(62.74,58.22) ; v1(94.49,69.86) 96.43,71.81 100.2,71.81 101.2,70.81 C1.1 107.22,69.99 KEY1.1 ; 37.34,37.14 H2.9
  Bottom Layer w0.254: v1(94.49,69.86) 82.84,58.22 v1(62.74,58.22) ; v1(59.56,37.14) H2.9
KEY2: length 97.2
  Top Layer w0.254: v1(59.94,40.94) 59.94,58.6 v1(63.12,61.77) ; H2.8 37.34,39.67 ; v1(94.49,75) 96.38,76.89 100.08,76.89 101.2,75.76 C2.1 101.39,75.23 KEY2.1
  Bottom Layer w0.254: v1(59.94,40.94) 58.67,39.67 H2.8 ; v1(63.12,61.77) 81.26,61.77 v1(94.49,75)
KEY3: length 98.6
  Top Layer w0.254: v1(55.75,64.19) v1(55.75,58.6) ; v1(94.49,80.13) 96.33,81.97 99.95,81.97 101.2,80.71 C3.1 101.28,80.19 KEY3.1 ; 37.34,42.22 H2.7
  Bottom Layer w0.254: H2.7 55.75,45.77 v1(55.75,58.6) ; v1(94.49,80.13) 80.2,65.84 57.4,65.84 v1(55.75,64.19)
KEY4: length 106.8
  Top Layer w0.254: KEY4.1 101.23,85.14 ; 101.23,85.14 C4.1 ; 101.23,85.14 101.23,85.77 99.95,87.05 96.27,87.05 v1(94.49,85.26) ; H2.6 37.34,44.75 ; v1(49.91,64.44) v1(49.91,58.98)
  Bottom Layer w0.254: v1(49.91,58.98) 49.91,47.04 H2.6 ; v1(49.91,64.44) 49.91,69.77 53.09,72.95 82.18,72.95 v1(94.49,85.26)
LED0: length 77.5
  Top Layer w0.254: 37.34,47.3 H2.5 50.93,48.56 v1(46.35,48.56) ; v1(38.23,63.3) 24.38,63.3 v1(22.61,65.08) ; v1(44.58,63.42) 45.34,62.66 v1(45.34,58.98) ; R6.2 22.61,77.64 v1(22.61,77.01)
  Bottom Layer w0.254: v1(45.34,58.98) 45.34,49.58 v1(46.35,48.56) ; v1(38.23,63.3) 44.45,63.3 v1(44.58,63.42) ; v1(22.61,77.01) v1(22.61,65.08)
RX: length 231.2
  Top Layer w0.254: 37.34,29.51 54.1,29.51 54.74,28.88 54.74,23.93 v1(55.63,23.04) ; v1(66.04,13.26) 66.17,13.13 v1(74.17,13.13)
  Bottom Layer w0.254: U3.4 41.91,87.94 51.05,97.08 107.06,97.08 111.63,92.51 111.63,67.49 104.78,60.63 104.78,20.12 99.95,15.29 76.33,15.29 v1(74.17,13.13) ; v1(55.63,23.04) 56.26,23.04 v1(66.04,13.26)
SCL: length 99.3
  Top Layer w0.254: v1(20.45,77.65) 20.45,87.68 24.38,91.62 灰度传感器接口.4 ; H1.5 22.1,19.35 ; v1(19.18,62.41) 19.94,63.17 19.94,68.76 v1(19.95,68.77)
  Bottom Layer w0.254: v1(19.18,62.41) 15.49,58.72 15.49,21.51 17.65,19.35 22.1,19.35 ; v1(19.95,68.77) 19.95,77.15 v1(20.45,77.65)
SDA: length 134.6
  Top Layer w0.254: 22.1,16.81 H1.4
  Bottom Layer w0.254: 灰度传感器接口.5 21.84,93.14 2.16,73.46 2.16,8.56 3.56,7.16 12.45,7.16 13.59,8.31 13.59,14.91 11.68,16.81 H1.4
TX: length 276.8
  Top Layer w0.254: v1(63.75,3.48) 63.88,3.35 v1(110.87,3.35) ; 37.34,26.97 H2.13
  Bottom Layer w0.254: v1(110.87,3.35) 118.11,10.59 118.11,92.13 117.22,93.02 115.32,93.02 109.35,98.98 49.91,98.98 U3.3 ; v1(63.75,3.48) 51.31,3.48 46.99,7.8 46.99,21.77 H2.13
$1N3173: length 9.3
  Top Layer w0.254: LED.1 32.91,79.32 32.26,78.66 28.96,78.66 28.37,79.25 R6.1

## Copper pours and planes (outline as drawn; the poured copper is in the pictures)
GND on Top Layer: -26.8,106.1 147.45,106.1 147.45,-13.54 -26.8,-13.54
GND on Bottom Layer: -16.51,105.59 144.91,105.59 144.91,-15.57 -16.51,-15.57

Small or netless copper shapes (teardrops, artwork), in the pictures only: 199 on Top Layer, 62 on Bottom Layer

## Text on the board
Top Silkscreen Layer: +5V*5 | 300块的陀螺仪 | PB3(Rx) | 调试串口 | OLCD | AT8236稳压驱动板 | 通信工程学院 | 西安电子科技大学
